# Altium schematic sheet Nguon.SchDoc
size A; SheetNumber: 1; SheetTotal: 3
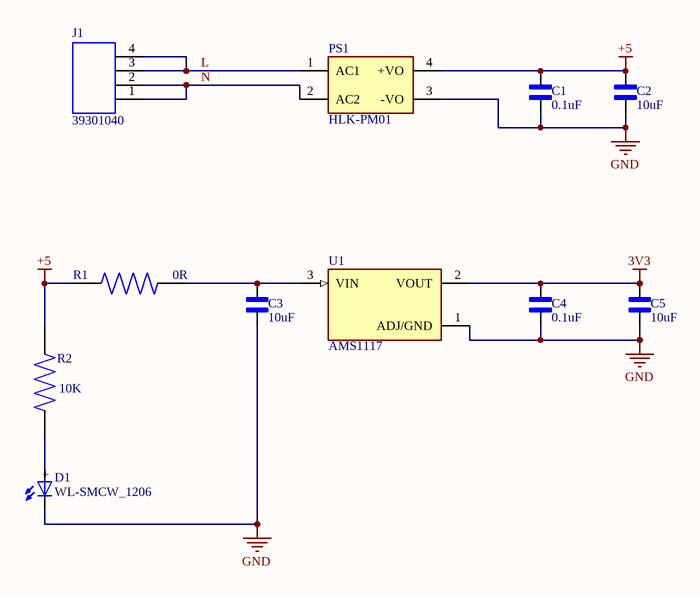
[diagram p0: Nguon.SchDoc]

## Parts
C1  0.1uF  [CAPC1608X94N]
C2  10uF  [CAPC1608X94N]
C3  10uF  [CAPC1608X94N]
C4  0.1uF  [CAPC1608X94N]
C5  10uF  [CAPC1608X94N]
D1  WL-SMCW_1206  [WL-SMCW_1206]
J1  39301040  [CONN_5569-04A_MOL]
PS1  HLK-PM01  [CONV_HLK-PM01]
R1  0R  [RES_ERJU03J474V]
R2  10K  [RES_ERJU03J474V]
U1  AMS1117  [SOT229P700X180-4N]

## Nets
3V3: C4.2 C5.2 U1.2(VOUT)
+5: C1.2 C2.2 PS1.4(+VO) R1.1 R2.1
GND: C1.1 C2.1 C3.1 C4.1 C5.1 D1.1(NEG) PS1.3(-VO) U1.1(ADJ/GND)
L: J1.3 J1.4 PS1.1(AC1)
N: J1.1 J1.2 PS1.2(AC2)
NetC3_2: C3.2 R1.2 U1.3(VIN)
NetD1_2: D1.2(POS) R2.2

## Notes on the sheet
- (in symbol WL-SMCW_1206) +

## Library data of the parts
C1-C5 = cap_0603_VJ0603D3R9DXCAP: cap 0603 (1608 Metric); MF: Vishay Vitramon; SnapEDA_Link: https://www.snapeda.com/parts/VJ0603D3R9DXCAP/Vishay/view-part/?ref=snap; Package: 1608 Vishay Vitramon; Value: *; MP: VJ0603D3R9DXCAP; Check_prices: https://www.snapeda.com/parts/VJ0603D3R9DXCAP/Vishay/view-part/?ref=eda
D1 = WL-SMCW_1206: 1206, Blue Typ.(@20mA): 470nm, 145mcd, 3.2V, 140Â° InGaN; MF: Wurth Electronics; MP: 150120BS75000; SnapEDA_Link: https://www.snapeda.com/parts/150120BS75000/Wurth+Electronics/view-part/?ref=snap; Package: 1206 Wurth Electronics; Value: *; Check_prices: https://www.snapeda.com/parts/150120BS75000/Wurth+Electronics/view-part/?ref=eda
J1 = 39301040: Conn Wire to Board HDR 4 POS 4.2mm Solder RA Side Entry Thru-Hole Mini-Fit Jrâ„¢ Bag; MF: Molex; SnapEDA_Link: https://www.snapeda.com/parts/39301040/Molex/view-part/?ref=snap; Package: None; Value: *; MP: 39301040; Check_prices: https://www.snapeda.com/parts/39301040/Molex/view-part/?ref=eda
PS1 = HLK-PM01: The HLK-PM01 is a small size low cost AC to DC converter which can take in 110V/220V AC at 50/60 Hz and give 5V 3W output. The module is can be used in designs which run on 5V and needs to be powered form the AC mains.; MF: Hi-link; SnapEDA_Link: https://www.snapeda.com/parts/hlk-pm01/Hi-link/view-part/?ref=snap; Package: None; Value: *; MP: hlk-pm01; Check_prices: https://www.snapeda.com/parts/hlk-pm01/Hi-link/view-part/?ref=eda
R1 R2 = res_0603_ERJU03J474V: 0603 Anti-Sulfurated; MF: Panasonic; SnapEDA_Link: https://www.snapeda.com/parts/ERJU03J474V/Panasonic/view-part/?ref=snap; Package: 1608-2 Panasonic; Value: *; MP: ERJU03J474V; Check_prices: https://www.snapeda.com/parts/ERJU03J474V/Panasonic/view-part/?ref=eda
U1 = AMS1117: 1A LOW DROPOUT VOLTAGE REGULATOR SOT-223; MF: Advanced Monolithic Systems; SnapEDA_Link: https://www.snapeda.com/parts/AMS1117/Advanced+Monolithic+Systems/view-part/?ref=snap; Package: SOT-223 Seeed Technology; Value: *; MP: AMS1117; Check_prices: https://www.snapeda.com/parts/AMS1117/Advanced+Monolithic+Systems/view-part/?ref=eda